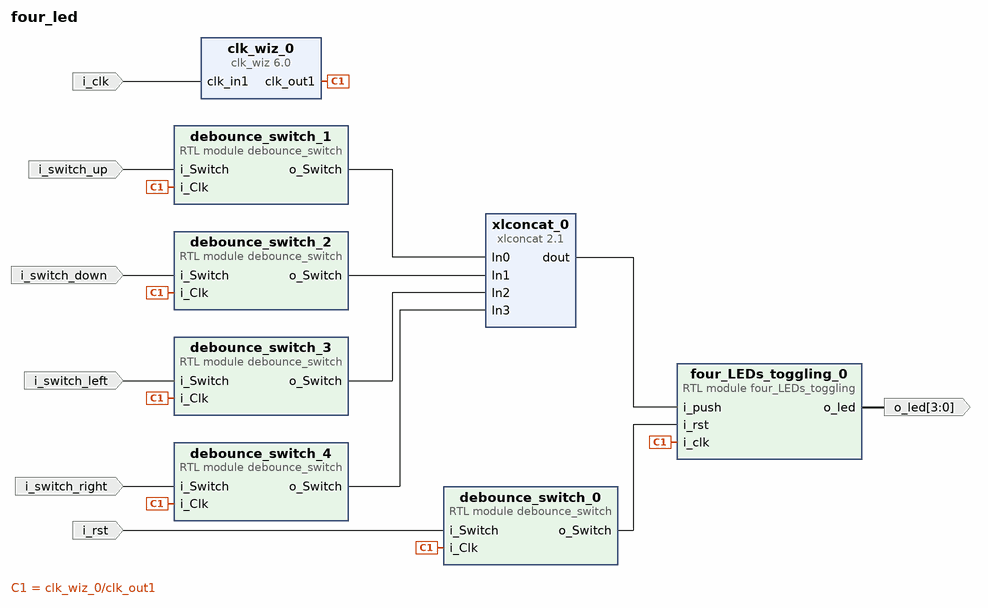
[diagram p0: block diagram of the top level]
# Vivado block design four_led, xc7z020clg400-1, Vivado 2025.2.1
create_bd_design four_led

create_bd_port -dir I -type clk i_clk
set_property -dict {CONFIG.FREQ_HZ 125000000} [get_bd_ports i_clk]
create_bd_port -dir O -from 3 -to 0 o_led
create_bd_port -dir I i_switch_up
create_bd_port -dir I i_switch_down
create_bd_port -dir I i_switch_left
create_bd_port -dir I i_switch_right
create_bd_port -dir I i_rst

create_bd_cell -type ip -vlnv xilinx.com:ip:clk_wiz:6.0 clk_wiz_0
set_property -dict [list \
  CONFIG.CLKIN1_JITTER_PS 80.0 \
  CONFIG.CLKOUT1_JITTER 312.659 \
  CONFIG.CLKOUT1_PHASE_ERROR 245.713 \
  CONFIG.CLKOUT1_REQUESTED_OUT_FREQ 25.000 \
  CONFIG.MMCM_CLKFBOUT_MULT_F 36.500 \
  CONFIG.MMCM_CLKIN1_PERIOD 8.000 \
  CONFIG.MMCM_CLKOUT0_DIVIDE_F 36.500 \
  CONFIG.MMCM_DIVCLK_DIVIDE 5 \
  CONFIG.PRIM_IN_FREQ 125.000 \
  CONFIG.USE_LOCKED false \
  CONFIG.USE_RESET false \
] [get_bd_cells clk_wiz_0]
create_bd_cell -type module -reference debounce_switch debounce_switch_0
create_bd_cell -type module -reference debounce_switch debounce_switch_1
create_bd_cell -type module -reference debounce_switch debounce_switch_2
create_bd_cell -type module -reference debounce_switch debounce_switch_3
create_bd_cell -type module -reference debounce_switch debounce_switch_4
create_bd_cell -type module -reference four_LEDs_toggling four_LEDs_toggling_0
create_bd_cell -type ip -vlnv xilinx.com:ip:xlconcat:2.1 xlconcat_0
set_property -dict {CONFIG.NUM_PORTS 4} [get_bd_cells xlconcat_0]

# ---- connections ----

connect_bd_net -net clk_in1_0_1 [get_bd_ports i_clk] [get_bd_pins clk_wiz_0/clk_in1]
connect_bd_net [get_bd_pins clk_wiz_0/clk_out1] \
  [get_bd_pins debounce_switch_0/i_Clk] [get_bd_pins debounce_switch_1/i_Clk] [get_bd_pins debounce_switch_2/i_Clk] \
  [get_bd_pins debounce_switch_3/i_Clk] [get_bd_pins debounce_switch_4/i_Clk] [get_bd_pins four_LEDs_toggling_0/i_clk]
connect_bd_net [get_bd_pins debounce_switch_0/o_Switch] [get_bd_pins four_LEDs_toggling_0/i_rst]
connect_bd_net [get_bd_pins debounce_switch_1/o_Switch] [get_bd_pins xlconcat_0/In0]
connect_bd_net [get_bd_pins debounce_switch_2/o_Switch] [get_bd_pins xlconcat_0/In1]
connect_bd_net [get_bd_pins debounce_switch_3/o_Switch] [get_bd_pins xlconcat_0/In2]
connect_bd_net [get_bd_pins debounce_switch_4/o_Switch] [get_bd_pins xlconcat_0/In3]
connect_bd_net [get_bd_pins four_LEDs_toggling_0/o_led] [get_bd_ports o_led]
connect_bd_net -net i_Switch_0_1 [get_bd_ports i_switch_up] [get_bd_pins debounce_switch_1/i_Switch]
connect_bd_net -net i_Switch_0_2 [get_bd_ports i_rst] [get_bd_pins debounce_switch_0/i_Switch]
connect_bd_net -net i_Switch_1_1 [get_bd_ports i_switch_down] [get_bd_pins debounce_switch_2/i_Switch]
connect_bd_net -net i_Switch_2_1 [get_bd_ports i_switch_left] [get_bd_pins debounce_switch_3/i_Switch]
connect_bd_net -net i_Switch_3_1 [get_bd_ports i_switch_right] [get_bd_pins debounce_switch_4/i_Switch]
connect_bd_net [get_bd_pins xlconcat_0/dout] [get_bd_pins four_LEDs_toggling_0/i_push]

validate_bd_design
save_bd_design
